# Altium schematic sheet USB32 GEN1 5G_FRONT.schdoc
size 420 x 298 mm; Symbol: Sheet-Symbol_A3; Company: 嘉立创EDA; Version: V1.0; Page Size: A3; @Project Name: H610(2024/12/09); @Page Count: 36; @Update Date: 2025-10-09; @Create Date: 2025-10-09; @Schematic Name: SCHEMATIC1; @Page No: 25; @Page Name: USB32 GEN1 5G_FRONT; Device: Sheet-Symbol_A3; @Board Name: SCHEMATIC1; @Create Time: 10:15:42; @Update Time: 10:18:20
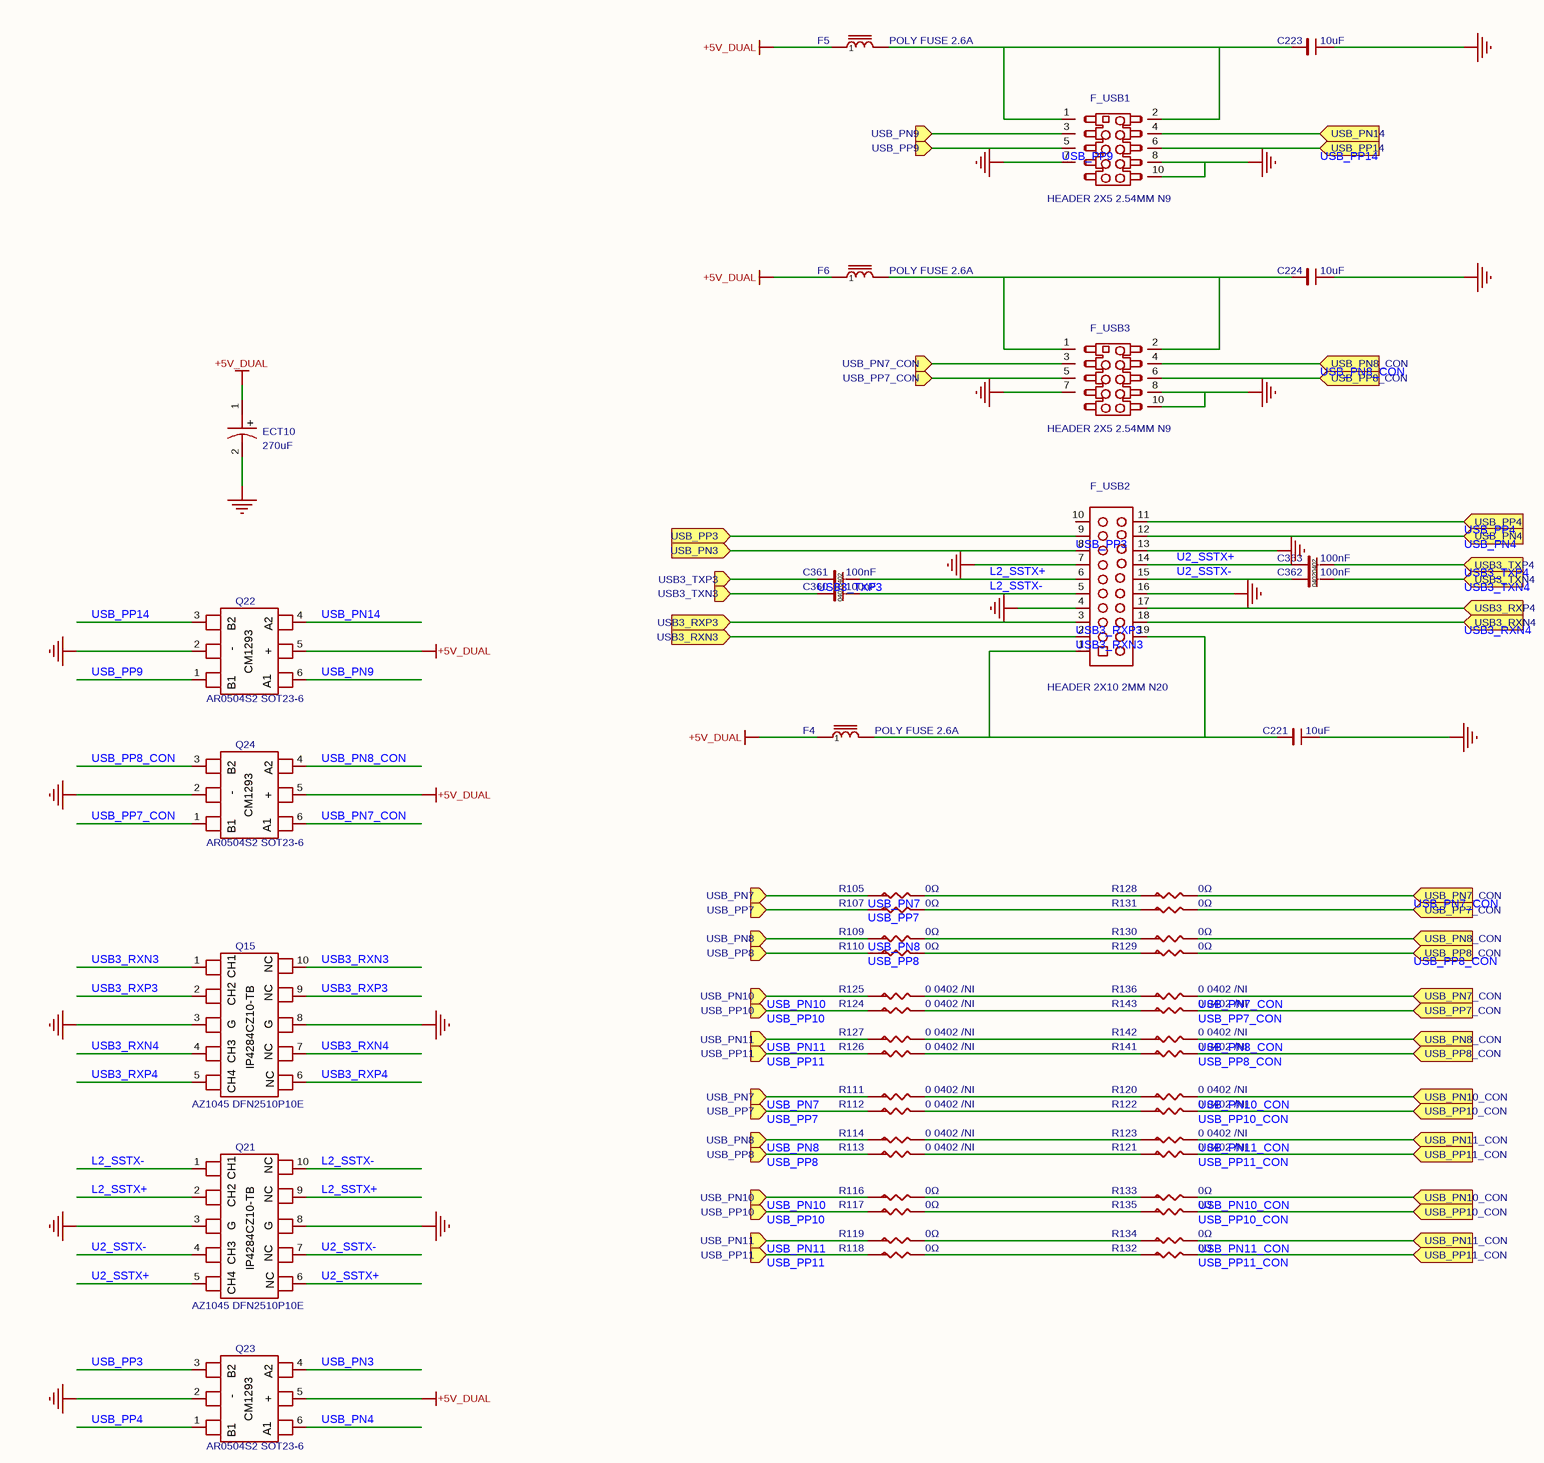
[diagram p0: USB32 GEN1 5G_FRONT.schdoc]

## Parts
C221  10uF  [C0603_1]
C223  10uF  [C0603_2]
C224  10uF  [C0603_1]
C360  100nF  [C0402_1]
C361  100nF  [C0402_1]
C362  100nF  [C0402_3]
C363  100nF  [C0402_3]
ECT10  270uF  [EC1P25C_2]
F4  value POLY FUSE 2.6A  [MINISMDC110]  (hidden comment: FERRITE BEAD)
F5  value POLY FUSE 2.6A  [MINISMDC110]  (hidden comment: FERRITE BEAD)
F6  value POLY FUSE 2.6A  [MINISMDC110]  (hidden comment: FERRITE BEAD)
F_USB1  value HEADER 2X5 2.54MM N9  [HDR-TH_10P-P2.54_210-82-05GB04]  (hidden comment: 210-82-05GB04)
F_USB2  value HEADER 2X10 2MM N20  [HEADER10X2_2MM_USB3_A]  (hidden comment: FRONT USB_0)
F_USB3  value HEADER 2X5 2.54MM N9  [HDR-TH_10P-P2.54_210-82-05GB04]  (hidden comment: 210-82-05GB04)
Q15  value AZ1045 DFN2510P10E  [DFN2510P10E_2]  (hidden comment: AZ1045-04F)
Q21  value AZ1045 DFN2510P10E  [DFN2510P10E_2]  (hidden comment: AZ1045-04F)
Q22  value AR0504S2 SOT23-6  [SOT23-6P-20051228]  (hidden comment: SRV05-4)
Q23  value AR0504S2 SOT23-6  [SOT23-6P-20051228]  (hidden comment: SRV05-4)
Q24  value AR0504S2 SOT23-6  [SOT23-6P-20051228]  (hidden comment: SRV05-4)
R105  0Ω  [R0402]
R107  0Ω  [R0402]
R109  0Ω  [R0402]
R110  0Ω  [R0402]
R111  value 0 0402 /NI  [R0402_2]  (hidden comment: 42A**-F)
R112  value 0 0402 /NI  [R0402_2]  (hidden comment: 42A**-F)
R113  value 0 0402 /NI  [R0402_2]  (hidden comment: 42A**-F)
R114  value 0 0402 /NI  [R0402_2]  (hidden comment: 42A**-F)
R116  0Ω  [R0402]
R117  0Ω  [R0402]
R118  0Ω  [R0402]
R119  0Ω  [R0402]
R120  value 0 0402 /NI  [R0402_2]  (hidden comment: 42A**-F)
R121  value 0 0402 /NI  [R0402_2]  (hidden comment: 42A**-F)
R122  value 0 0402 /NI  [R0402_2]  (hidden comment: 42A**-F)
R123  value 0 0402 /NI  [R0402_2]  (hidden comment: 42A**-F)
R124  value 0 0402 /NI  [R0402_2]  (hidden comment: 42A**-F)
R125  value 0 0402 /NI  [R0402_2]  (hidden comment: 42A**-F)
R126  value 0 0402 /NI  [R0402_2]  (hidden comment: 42A**-F)
R127  value 0 0402 /NI  [R0402_2]  (hidden comment: 42A**-F)
R128  0Ω  [R0402]
R129  0Ω  [R0402]
R130  0Ω  [R0402]
R131  0Ω  [R0402]
R132  0Ω  [R0402]
R133  0Ω  [R0402]
R134  0Ω  [R0402]
R135  0Ω  [R0402]
R136  value 0 0402 /NI  [R0402_2]  (hidden comment: 42A**-F)
R141  value 0 0402 /NI  [R0402_2]  (hidden comment: 42A**-F)
R142  value 0 0402 /NI  [R0402_2]  (hidden comment: 42A**-F)
R143  value 0 0402 /NI  [R0402_2]  (hidden comment: 42A**-F)

## Ports
USB3_RXN3 (in), USB3_RXN4 (in), USB3_RXP3 (in), USB3_RXP4 (in), USB3_TXN3 (in), USB3_TXN4 (in), USB3_TXP3 (in), USB3_TXP4 (in), USB_PN3 (in), USB_PN4 (in), USB_PN7 (in), USB_PN7_CON (in), USB_PN8 (in), USB_PN8_CON (in), USB_PN9 (in), USB_PN10 (in), USB_PN10_CON (in), USB_PN11 (in), USB_PN11_CON (in), USB_PN14 (in), USB_PP3 (in), USB_PP4 (in), USB_PP7 (in), USB_PP7_CON (in), USB_PP8 (in), USB_PP8_CON (in), USB_PP9 (in), USB_PP10 (in), USB_PP10_CON (in), USB_PP11 (in), USB_PP11_CON (in), USB_PP14 (in)

## Nets
+5V_DUAL: ECT10.1 F4.1 F5.1 F6.1 Q22.5(+) Q23.5(+) Q24.5(+)
GND: C221.2 C223.2 C224.2 ECT10.2 F_USB1.7 F_USB1.8 F_USB1.10 F_USB2.4 F_USB2.7 F_USB2.13 F_USB2.16 F_USB3.7 F_USB3.8 F_USB3.10 Q15.3 Q15.8 Q21.3 Q21.8 Q22.2 Q23.2 Q24.2
L2_SSTX+: C361.2 F_USB2.6 Q21.2 Q21.9
L2_SSTX-: C360.2 F_USB2.5 Q21.1 Q21.10
U2_SSTX+: C363.1 F_USB2.14 Q21.5(+) Q21.6
U2_SSTX-: C362.1 F_USB2.15 Q21.4 Q21.7
USB3_RXN3: F_USB2.2 Q15.1 Q15.10 ; port USB3_RXN3
USB3_RXN4: F_USB2.18 Q15.4 Q15.7 ; port USB3_RXN4
USB3_RXP3: F_USB2.3 Q15.2 Q15.9 ; port USB3_RXP3
USB3_RXP4: Q15.5(+) Q15.6
USB3_RXP4: F_USB2.17 ; port USB3_RXP4  [a separate net that carries the same name]
USB3_TXN3: C360.1 ; port USB3_TXN3
USB3_TXN4: C362.2 ; port USB3_TXN4
USB3_TXP3: C361.1 ; port USB3_TXP3
USB3_TXP4: C363.2 ; port USB3_TXP4
USB_PN3: Q23.4
USB_PN3: F_USB2.8 ; port USB_PN3  [a separate net that carries the same name]
USB_PN4: F_USB2.12 Q23.6 ; port USB_PN4
USB_PN7: R105.1 R111.1 ; port USB_PN7
USB_PN7_CON: F_USB3.3 Q24.6 R128.2 R136.2 ; port USB_PN7_CON
USB_PN8: R109.1 R114.1 ; port USB_PN8
USB_PN8_CON: F_USB3.4 Q24.4 R130.2 R142.2 ; port USB_PN8_CON
USB_PN9: F_USB1.3 ; port USB_PN9
USB_PN9: Q22.6  [a separate net that carries the same name]
USB_PN10: R116.1 R125.1 ; port USB_PN10
USB_PN10_CON: R120.2 R133.2 ; port USB_PN10_CON
USB_PN11: R119.1 R127.1 ; port USB_PN11
USB_PN11_CON: R123.2 R134.2 ; port USB_PN11_CON
USB_PN14: F_USB1.4 ; port USB_PN14
USB_PN14: Q22.4  [a separate net that carries the same name]
USB_PP3: F_USB2.9 Q23.3 ; port USB_PP3
USB_PP4: F_USB2.11 Q23.1 ; port USB_PP4
USB_PP7: R107.1 R112.1 ; port USB_PP7
USB_PP7_CON: F_USB3.5 Q24.1 R131.2 R143.2 ; port USB_PP7_CON
USB_PP8: R110.1 R113.1 ; port USB_PP8
USB_PP8_CON: F_USB3.6 Q24.3 R129.2 R141.2 ; port USB_PP8_CON
USB_PP9: F_USB1.5 Q22.1 ; port USB_PP9
USB_PP10: R117.1 R124.1 ; port USB_PP10
USB_PP10_CON: R122.2 R135.2 ; port USB_PP10_CON
USB_PP11: R118.1 R126.1 ; port USB_PP11
USB_PP11_CON: R121.2 R132.2 ; port USB_PP11_CON
USB_PP14: F_USB1.6 Q22.3 ; port USB_PP14
NetC221_1: C221.1 F4.2 F_USB2.1 F_USB2.19
NetC223_1: C223.1 F5.2 F_USB1.1 F_USB1.2
NetC224_1: C224.1 F6.2 F_USB3.1 F_USB3.2
NetR105_2: R105.2 R128.1
NetR107_2: R107.2 R131.1
NetR109_2: R109.2 R130.1
NetR110_2: R110.2 R129.1
NetR111_2: R111.2 R120.1
NetR112_2: R112.2 R122.1
NetR113_2: R113.2 R121.1
NetR114_2: R114.2 R123.1
NetR116_2: R116.2 R133.1
NetR117_2: R117.2 R135.1
NetR118_2: R118.2 R132.1
NetR119_2: R119.2 R134.1
NetR124_2: R124.2 R143.1
NetR125_2: R125.2 R136.1
NetR126_2: R126.2 R141.1
NetR127_2: R127.2 R142.1

Not connected (* = marked no-connect by the designer): F_USB2 10

## Notes on the sheet
- 更新日期
- 2025-10-09
- 原理图
- 图页
- SCHEMATIC1
- USB32 GEN1 5G_FRONT
- 创建日期
- 物料编码
- 审阅
- 绘制
- H610(2024/12/09)
- 版本
- V1.0
- 尺寸
- A3
- 页
- 25
- 嘉立创EDA
- 共
- 36
- (in symbol 160AREC271M0609) +
- (in symbol AZ1045-04F) CH1; NC; CH2; G; CH3; IP4284CZ10-TB; CH4
- (in symbol SRV05-4_C558418) B2; A2; CM1293; -; B1; A1

## Library data of the parts
C221 C223 C224 = CL10A106KP8NNNC: 容值:10uF;精度:±10%;额定电压:10V;材质(温度系数):X5R;; Manufacturer: SAMSUNG(三星); Symbol: C0805; ModelId: ac125912035d415993ca9572d50418b1; Tolerance: ±10%; AddInBom: yes; Voltage Rated: 10V; ModelName: C0603_L1.6-W0.8-H0.8; ModelTransform: 62.992,31.496,0,0,0,0,0,0,0; Temperature Coefficient: X5R; Device: CL10A106KP8NNNC; Value: 10uF; Supplier: LCSC; Datasheet: https://atta.szlcsc.com/upload/public/pdf/source/20160103/1457707703378.pdf; SupplierPart: C19702; ConvertToPcb: yes; LCSC Part Name: 10uF ±10% 10V; JLCPCB Part Class: Basic Part; ManufacturerPart: CL10A106KP8NNNC; Supplier Footprint: 0603
  C221 C224: FootprintName: C0603_1
  C223: FootprintName: C0603_2
C360-C363 = CL05B104KO5NNNC: 容值:100nF;精度:±10%;额定电压:16V;材质(温度系数):X7R;; Manufacturer: SAMSUNG(三星); Symbol: C0402; ModelId: 36a51122f27c49738f86b3bfa98863e0; Tolerance: ±10%; AddInBom: yes; Voltage Rated: 16V; ModelName: C0402_L1.0-W0.5-H0.5; ModelTransform: 39.37,19.685,0,0,0,0,0,0,0; Temperature Coefficient: X7R; Device: CL05B104KO5NNNC; Value: 100nF; Supplier: LCSC; Datasheet: https://atta.szlcsc.com/upload/public/pdf/source/20160103/1457707674891.pdf; SupplierPart: C1525; ConvertToPcb: yes; LCSC Part Name: 100nF ±10% 16V; JLCPCB Part Class: Basic Part; ManufacturerPart: CL05B104KO5NNNC; Supplier Footprint: 0402
  C360 C361: FootprintName: C0402_1
  C362 C363: FootprintName: C0402_3
ECT10 = 160AREC271M0609: 容值:270uF;精度:±20%;额定电压:16V;纹波电流:3.8A@100kHz;等效串联电阻:15mΩ@100kHz~300kHz;类型:-;; Manufacturer: APAQ(钰邦); Symbol: CAPACITOR POL_0; AddInBom: yes; ModelId: 0a4db4bf24b443b3be4905be97ff10c5; ModelName: CAP-TH_BD6.3-P2.50-D1.0-FD; ModelTransform: 248.4247,247.99777,0,0,0,0,0,0,-137.795; Tolerance: ±20%; Rated Voltage: 16V; φD: 6.3mm; L: 9mm; Lifetime @ Temp: 2000hrs@105℃; Device: 160AREC271M0609; Value: 270uF; LCSC Part Name: 270uF ±20% 16V; SupplierPart: C176312; ManufacturerPart: 160AREC271M0609; Supplier Footprint: 插件,D6.3xL9mm; JLCPCB Part Class: Extended Part; Datasheet: https://atta.szlcsc.com/upload/public/pdf/source/20180420/C176312_A6CC051F3F5535015096354530D22B11.pdf; Supplier: LCSC; ConvertToPcb: yes; FootprintName: EC1P25C_2; Ripple Current: 3.8A@100kHz; Equivalent Series Resistance(ESR): 15mΩ@100kHz~300kHz; Type: -; Lead Spacing: 2.5mm; Operating Temperature: -55℃~+105℃
F4-F6 = FERRITE BEAD_3: Check: false; AddInBom: yes; Device: FERRITE BEAD_3; Symbol: FERRITE BEAD; FootprintName: MINISMDC110; ConvertToPcb: yes
F_USB1 F_USB3 = 210-82-05GB04: 插针结构:2x5P;间距:2.54mm;行距:2.54mm;圆针/方针:方针;安装类型:直插;排数:双排;总PIN位数:10P;额定电流:3A;额定电压:-;配合针长度:6.1mm;塑高:2.5mm;端接针长度:3mm;触头材质:黄铜;触头镀层:-;工作温度范围:-40℃~+105℃;颜色:黑色;; Manufacturer: PINREX(频锐科技); Symbol: PIN HEADER 2X7 2_1.54; AddInBom: yes; ModelId: 31e5a6c7bb854324bc4de0ff3146e549; ModelTransform: 490.157,196.85,0,0,0,0,0,0,-118.11; Pin Structure: 2x5P; Pitch: 2.54mm; Circluar Pins/Square Pins: 方针; Current Rating (Max): 3A; Device: 210-82-05GB04; JLCPCB Part Class: Extended Part; LCSC Part Name: 间距:2.54mm 2x5P 直插 方针 黑金; SupplierPart: C390686; ManufacturerPart: 210-82-05GB04; Supplier Footprint: 插件,P=2.54mm; Datasheet: https://atta.szlcsc.com/upload/public/pdf/source/20190506/C390686_AFD667042634CF7F90D18338E0712651.pdf; Supplier: LCSC; ConvertToPcb: yes; FootprintName: HDR-TH_10P-P2.54_210-82-05GB04; ModelName: HDR-TH_10P-P2.54_210-82-05GB04; Row Spacing: 2.54mm; Mounting Type: 直插; Number of Rows: 双排; Number of Pins: 10P; Voltage Rating (Max): -; Length of Mating Pin: 6.1mm; Insulation Height: 2.5mm; Length of End Connection Pin: 3mm; Contact Material: 黄铜; Contact Plating: -; Operating Temperature Range: -40℃~+105℃; Color: 黑色
F_USB2 = FRONT USB_0: Check: false; AddInBom: yes; Device: FRONT USB_0; Symbol: FRONT USB_0; FootprintName: HEADER10X2_2MM_USB3_A; ConvertToPcb: yes
Q15 Q21 = AZ1045-04F: Manufacturer: TECH PUBLIC(台舟); Symbol: CM1293_1; AddInBom: yes; ModelId: 55525fa8fc914f7c8ffcb10749ea5f73; ModelName: DFN-10_L2.5-W1.0-H0.5-P0.50; ModelTransform: 40.1574,98.425,0,90,0,0,0,0,0; Type: ESD; Device: AZ1045-04F; LCSC Part Name: AZ1045-04F; SupplierPart: C2987152; ManufacturerPart: AZ1045-04F; Supplier Footprint: DFN2510-10; JLCPCB Part Class: Extended Part; Datasheet: https://atta.szlcsc.com/upload/public/pdf/source/20220406/8EAFF16680D4CFE618D2B8CBCD10F1DA.pdf; Supplier: LCSC; ConvertToPcb: yes; FootprintName: DFN2510P10E_2
Q22-Q24 = SRV05-4_C558418: 反向截止电压(Vrwm):5V;最大钳位电压:20V;峰值脉冲电流(Ipp)@10/1000us:3A;击穿电压:6V;; Manufacturer: TECH PUBLIC(台舟); Symbol: CM1293_0; AddInBom: yes; ModelId: 18da8f6c14a34920b3e136b5c401a119; ModelName: SOT-23-6_L2.9-W1.6-H1.5-LS2.8-P0.95; ModelTransform: 110.236,113.364,0,90,0,0,0.0005,0.0005,0; Reverse Stand-Off Voltage (Vrwm): 5V; Maximum Clamping Voltage: 20V; Peak Pulse Current (Ipp)@10/1000us: 3A; Breakdown Voltage: 6V; Type: ESD; Device: SRV05-4_C558418; LCSC Part Name: ESD，可防25kV静电; SupplierPart: C558418; ManufacturerPart: SRV05-4; Supplier Footprint: SOT-23-6; JLCPCB Part Class: Extended Part; Datasheet: https://atta.szlcsc.com/upload/public/pdf/source/20230615/CFFDFFE99FDA0E92DF9600783B3A2A20.pdf; Supplier: LCSC; ConvertToPcb: yes; FootprintName: SOT23-6P-20051228
R105 R107 R109 R110 R116-R119 R128-R135 = 0402WGF0000TCE: 电阻类型:厚膜电阻;阻值:0Ω;精度:±1%;功率:62.5mW;; Manufacturer: UNI-ROYAL(厚声); Symbol: 42A**-F; ModelId: 671aefced39d4c318694bba8bd8efd39; Tolerance: ±1%; AddInBom: yes; Power(Watts): 62.5mW; ModelName: R0402_L1.0-W0.5-H0.5; ModelTransform: 39.37,19.685,0,0,0,0,0,0.0005,0; Overload Voltage (Max): 50V; Temperature Coefficient: ±800ppm/℃; Device: 0402WGF0000TCE; PCB Footprint: R0402; Value: 0Ω; Type: 厚膜电阻; Supplier: LCSC; Datasheet: https://atta.szlcsc.com/upload/public/pdf/source/20200306/C422600_1E6D84923E4A46A82E41ADD87F860B5C.pdf; FootprintName: R0402; SupplierPart: C17168; ConvertToPcb: yes; LCSC Part Name: 0Ω ±1% 62.5mW; JLCPCB Part Class: Basic Part; ManufacturerPart: 0402WGF0000TCE; Supplier Footprint: 0402; Operating Temperature Range: -55℃~+155℃
R111-R114 R120-R127 R136 R141-R143 = 42A**-F_1: Manufacturer: UNI-ROYAL(厚声); Manufacturer Part: 0402WGF0000TCE; Add into BOM: no; PCB Footprint: R0402; 3D Model: 671aefced39d4c318694bba8bd8efd39; 3D Model Transform: 39.37,19.685,0,0,0,0,0,0.0005,0; Tolerance: ±1%; Power(Watts): 62.5mW; Overload Voltage (Max): 50V; Temperature Coefficient: ±800ppm/℃; Convert to PCB: no; Device: 42A**-F_1; Symbol: 42A**-F; LCSC Part Name: 0Ω ±1% 62.5mW 厚膜电阻; Supplier Part: C17168; Supplier Footprint: 0402; JLCPCB Part Class: Basic Part; Datasheet: https://atta.szlcsc.com/upload/public/pdf/source/20200306/C422600_1E6D84923E4A46A82E41ADD87F860B5C.pdf; Supplier: LCSC; Type: 厚膜电阻; Operating Temperature Range: -55℃~+155℃; FootprintName: R0402_2